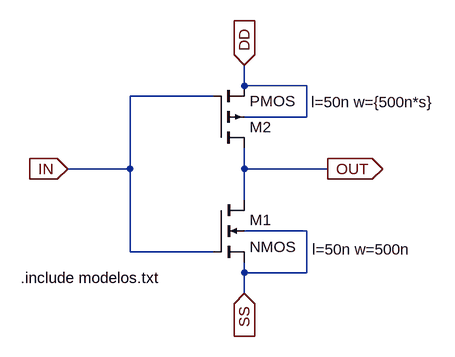
[diagram p0: schematic inversorp.asc]
inversorp.asc, the LTspice schematic file:
Version 4
SHEET 1 1048 680
WIRE 112 32 112 0
WIRE 208 32 112 32
WIRE 64 48 -64 48
WIRE 208 80 208 32
WIRE 208 80 112 80
WIRE -64 160 -64 48
WIRE -64 160 -160 160
WIRE 112 160 112 128
WIRE 240 160 112 160
WIRE 112 208 112 160
WIRE 208 256 112 256
WIRE -64 288 -64 160
WIRE 64 288 -64 288
WIRE 112 320 112 304
WIRE 208 320 208 256
WIRE 208 320 112 320
WIRE 112 352 112 320
FLAG 112 0 DD
IOPIN 112 0 In
FLAG -160 160 IN
IOPIN -160 160 In
FLAG 240 160 OUT
IOPIN 240 160 Out
FLAG 112 352 SS
IOPIN 112 352 In
SYMBOL nmos4 64 208 R0
WINDOW 123 152 76 Left 2
WINDOW 0 56 31 Left 2
SYMATTR Value2 l=50n w=500n
SYMATTR InstName M1
SYMBOL pmos4 64 128 M180
WINDOW 123 151 71 Left 2
SYMATTR Value2 l=50n w={500n*s}
SYMATTR InstName M2
TEXT -232 328 Left 2 !.include modelos.txt

The netlist it stands for:
* inversorp.asc
M1 OUT IN SS SS NMOS l=50n w=500n
M2 OUT IN DD DD PMOS l=50n w={500n*s}
.model NMOS NMOS
.model PMOS PMOS
.lib standard.mos
.include modelos.txt
.backanno
.end